# Altium schematic sheet PS_IO.SchDoc
size A4; SheetNumber: 2; SheetTotal: 11
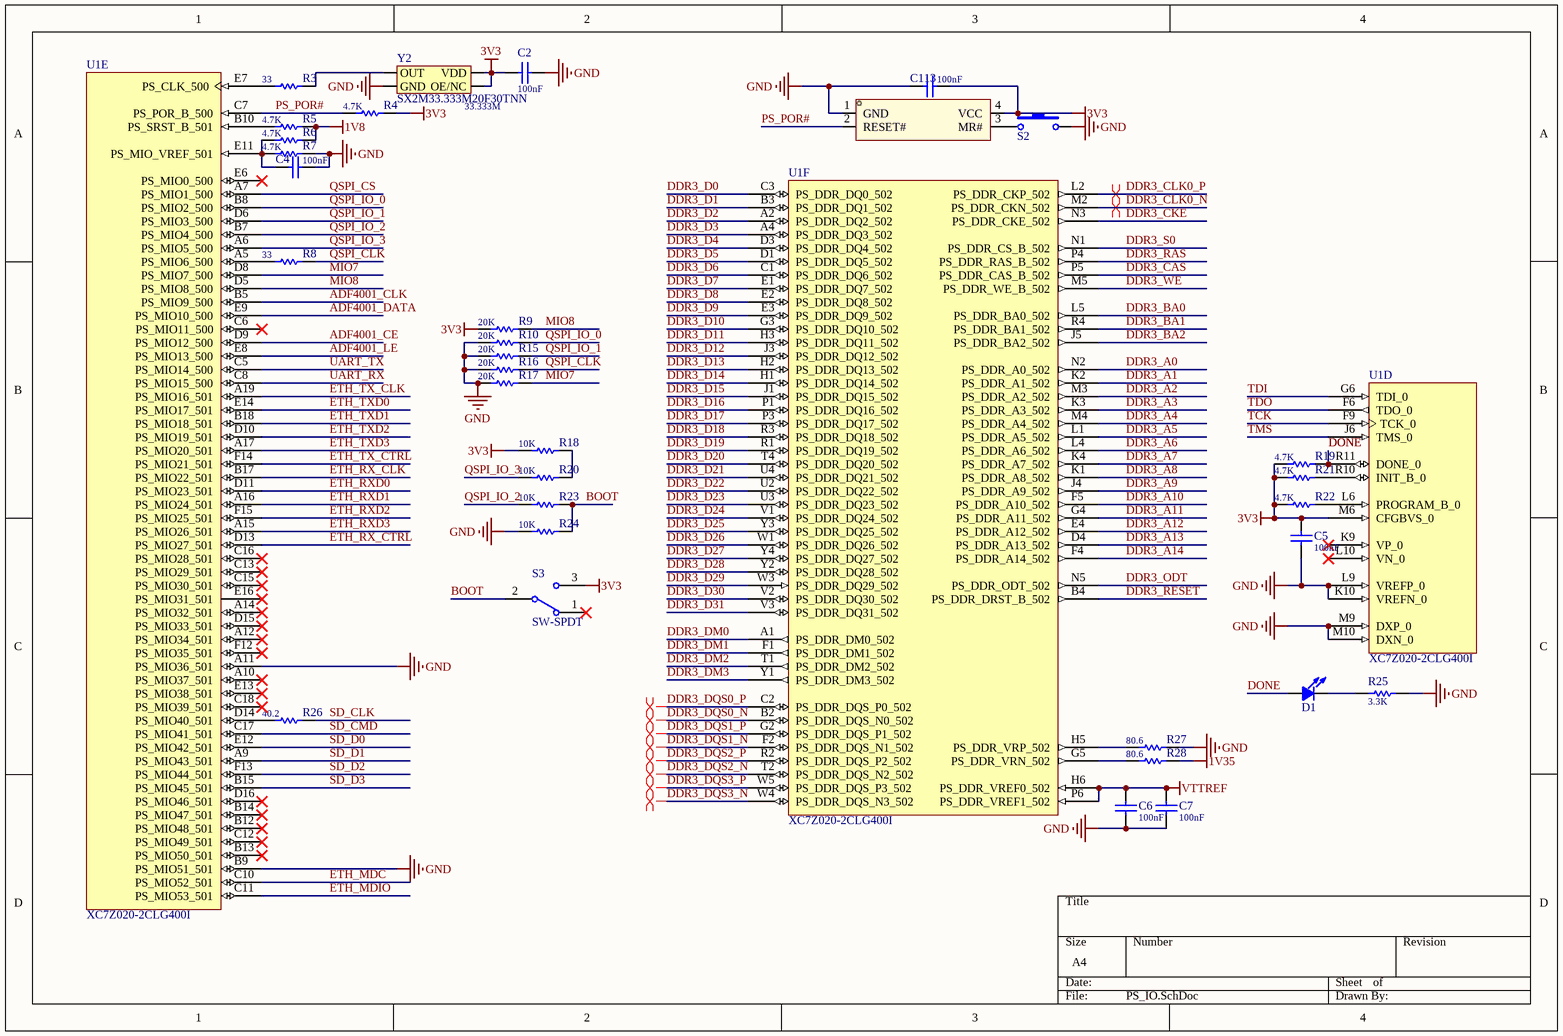
[diagram p0: PS_IO.SchDoc]

## Parts
C2  value 100nF  [C0402-L]  (hidden comment: Cap-S)
C4  value 100nF  [C0402-L]  (hidden comment: Cap-S)
C5  value 100nF  [C0402-L]  (hidden comment: Cap-S)
C6  value 100nF  [C0402-S]  (hidden comment: Cap-S)
C7  value 100nF  [C0402-S]  (hidden comment: Cap-S)
C113  value 100nF  [C0402-L]  (hidden comment: Cap-S)
D1  LED  [LED_0603_L]  (value not drawn)
R3  value 33  [R0402-L]  (hidden comment: R)
R4  value 4.7K  [R0402-L]  (hidden comment: R)
R5  value 4.7K  [R0402-L]  (hidden comment: R)
R6  value 4.7K  [R0402-L]  (hidden comment: R)
R7  value 4.7K  [R0402-L]  (hidden comment: R)
R8  value 33  [R0402-L]  (hidden comment: R)
R9  value 20K  [R0402-L]  (hidden comment: R)
R10  value 20K  [R0402-L]  (hidden comment: R)
R15  value 20K  [R0402-L]  (hidden comment: R)
R16  value 20K  [R0402-L]  (hidden comment: R)
R17  value 20K  [R0402-L]  (hidden comment: R)
R18  value 10K  [R0402-L]  (hidden comment: R)
R19  value 4.7K  [R0402-L]  (hidden comment: R)
R20  value 10K  [R0402-L]  (hidden comment: R)
R21  value 4.7K  [R0402-L]  (hidden comment: R)
R22  value 4.7K  [R0402-L]  (hidden comment: R)
R23  value 10K  [R0402-L]  (hidden comment: R)
R24  value 10K  [R0402-L]  (hidden comment: R)
R25  value 3.3K  [R0603-L]  (hidden comment: R)
R26  value 40.2  [R0402-L]  (hidden comment: R)
R27  value 80.6  [R0402-S]  (hidden comment: R)
R28  value 80.6  [R0402-S]  (hidden comment: R)
S2  SW-PB2  [SW-PB2-SMD]  (value not drawn)
S3  SW-SPDT  [SW-TH_MSK12C02]
U1  XC7Z020-2CLG400I  [CLG400]  (parts D,E,F of 9)
U9  HX811T  [SOT-143_L2.9-W1.3-P1.92-LS2.3-BL]  (value not drawn)
Y2  SX2M33.333M20F30TNN  value 33.333M  [XTAL-2520]

## Nets
1V8: R5.1 R6.1
1V35: R28.1
3V3: C2.2 C5.1 C113.1 R4.1 R9.2 R18.2 R19.2 R21.2 R22.2 S3.3 U1.M6(CFGBVS_0) U9.4(VCC) Y2.1(OE/NC) Y2.4(VDD)
GND: C2.1 C4.1 C5.2 C6.1 C7.1 C113.2 R7.1 R10.2 R15.2 R16.2 R17.2 R24.2 R25.2 R27.1 S2.2 U1.A11(PS_MIO36_501) U1.B9(PS_MIO51_501) U1.K10(VREFN_0) U1.L9(VREFP_0) U1.M9(DXP_0) U1.M10(DXN_0) U9.1(GND) Y2.2(GND)
VTTREF: C6.2 C7.2 U1.H6(PS_DDR_VREF0_502) U1.P6(PS_DDR_VREF1_502)
ADF4001_CE: U1.D9(PS_MIO12_500)
ADF4001_CLK: U1.B5(PS_MIO9_500)
ADF4001_DATA: U1.E9(PS_MIO10_500)
ADF4001_LE: U1.E8(PS_MIO13_500)
BOOT: R23.1 R24.1 S3.2
DDR3_A0: U1.N2(PS_DDR_A0_502)
DDR3_A1: U1.K2(PS_DDR_A1_502)
DDR3_A2: U1.M3(PS_DDR_A2_502)
DDR3_A3: U1.K3(PS_DDR_A3_502)
DDR3_A4: U1.M4(PS_DDR_A4_502)
DDR3_A5: U1.L1(PS_DDR_A5_502)
DDR3_A6: U1.L4(PS_DDR_A6_502)
DDR3_A7: U1.K4(PS_DDR_A7_502)
DDR3_A8: U1.K1(PS_DDR_A8_502)
DDR3_A9: U1.J4(PS_DDR_A9_502)
DDR3_A10: U1.F5(PS_DDR_A10_502)
DDR3_A11: U1.G4(PS_DDR_A11_502)
DDR3_A12: U1.E4(PS_DDR_A12_502)
DDR3_A13: U1.D4(PS_DDR_A13_502)
DDR3_A14: U1.F4(PS_DDR_A14_502)
DDR3_BA0: U1.L5(PS_DDR_BA0_502)
DDR3_BA1: U1.R4(PS_DDR_BA1_502)
DDR3_BA2: U1.J5(PS_DDR_BA2_502)
DDR3_CAS: U1.P5(PS_DDR_CAS_B_502)
DDR3_CKE: U1.N3(PS_DDR_CKE_502)
DDR3_CLK0_N: U1.M2(PS_DDR_CKN_502)
DDR3_CLK0_P: U1.L2(PS_DDR_CKP_502)
DDR3_D0: U1.C3(PS_DDR_DQ0_502)
DDR3_D1: U1.B3(PS_DDR_DQ1_502)
DDR3_D2: U1.A2(PS_DDR_DQ2_502)
DDR3_D3: U1.A4(PS_DDR_DQ3_502)
DDR3_D4: U1.D3(PS_DDR_DQ4_502)
DDR3_D5: U1.D1(PS_DDR_DQ5_502)
DDR3_D6: U1.C1(PS_DDR_DQ6_502)
DDR3_D7: U1.E1(PS_DDR_DQ7_502)
DDR3_D8: U1.E2(PS_DDR_DQ8_502)
DDR3_D9: U1.E3(PS_DDR_DQ9_502)
DDR3_D10: U1.G3(PS_DDR_DQ10_502)
DDR3_D11: U1.H3(PS_DDR_DQ11_502)
DDR3_D12: U1.J3(PS_DDR_DQ12_502)
DDR3_D13: U1.H2(PS_DDR_DQ13_502)
DDR3_D14: U1.H1(PS_DDR_DQ14_502)
DDR3_D15: U1.J1(PS_DDR_DQ15_502)
DDR3_D16: U1.P1(PS_DDR_DQ16_502)
DDR3_D17: U1.P3(PS_DDR_DQ17_502)
DDR3_D18: U1.R3(PS_DDR_DQ18_502)
DDR3_D19: U1.R1(PS_DDR_DQ19_502)
DDR3_D20: U1.T4(PS_DDR_DQ20_502)
DDR3_D21: U1.U4(PS_DDR_DQ21_502)
DDR3_D22: U1.U2(PS_DDR_DQ22_502)
DDR3_D23: U1.U3(PS_DDR_DQ23_502)
DDR3_D24: U1.V1(PS_DDR_DQ24_502)
DDR3_D25: U1.Y3(PS_DDR_DQ25_502)
DDR3_D26: U1.W1(PS_DDR_DQ26_502)
DDR3_D27: U1.Y4(PS_DDR_DQ27_502)
DDR3_D28: U1.Y2(PS_DDR_DQ28_502)
DDR3_D29: U1.W3(PS_DDR_DQ29_502)
DDR3_D30: U1.V2(PS_DDR_DQ30_502)
DDR3_D31: U1.V3(PS_DDR_DQ31_502)
DDR3_DM0: U1.A1(PS_DDR_DM0_502)
DDR3_DM1: U1.F1(PS_DDR_DM1_502)
DDR3_DM2: U1.T1(PS_DDR_DM2_502)
DDR3_DM3: U1.Y1(PS_DDR_DM3_502)
DDR3_DQS0_N: U1.B2(PS_DDR_DQS_N0_502)
DDR3_DQS0_P: U1.C2(PS_DDR_DQS_P0_502)
DDR3_DQS1_N: U1.F2(PS_DDR_DQS_N1_502)
DDR3_DQS1_P: U1.G2(PS_DDR_DQS_P1_502)
DDR3_DQS2_N: U1.T2(PS_DDR_DQS_N2_502)
DDR3_DQS2_P: U1.R2(PS_DDR_DQS_P2_502)
DDR3_DQS3_N: U1.W4(PS_DDR_DQS_N3_502)
DDR3_DQS3_P: U1.W5(PS_DDR_DQS_P3_502)
DDR3_ODT: U1.N5(PS_DDR_ODT_502)
DDR3_RAS: U1.P4(PS_DDR_RAS_B_502)
DDR3_RESET: U1.B4(PS_DDR_DRST_B_502)
DDR3_S0: U1.N1(PS_DDR_CS_B_502)
DDR3_WE: U1.M5(PS_DDR_WE_B_502)
DONE: D1.1 R19.1 U1.R11(DONE_0)
ETH_MDC: U1.C10(PS_MIO52_501)
ETH_MDIO: U1.C11(PS_MIO53_501)
ETH_RX_CLK: U1.B17(PS_MIO22_501)
ETH_RX_CTRL: U1.D13(PS_MIO27_501)
ETH_RXD0: U1.D11(PS_MIO23_501)
ETH_RXD1: U1.A16(PS_MIO24_501)
ETH_RXD2: U1.F15(PS_MIO25_501)
ETH_RXD3: U1.A15(PS_MIO26_501)
ETH_TX_CLK: U1.A19(PS_MIO16_501)
ETH_TX_CTRL: U1.F14(PS_MIO21_501)
ETH_TXD0: U1.E14(PS_MIO17_501)
ETH_TXD1: U1.B18(PS_MIO18_501)
ETH_TXD2: U1.D10(PS_MIO19_501)
ETH_TXD3: U1.A17(PS_MIO20_501)
MIO7: R17.1 U1.D8(PS_MIO7_500)
MIO8: R9.1 U1.D5(PS_MIO8_500)
PS_POR#: R4.2 U1.C7(PS_POR_B_500) U9.2(RESET#)
QSPI_CLK: R8.1 R16.1
QSPI_CS: U1.A7(PS_MIO1_500)
QSPI_IO_0: R10.1 U1.B8(PS_MIO2_500)
QSPI_IO_1: R15.1 U1.D6(PS_MIO3_500)
QSPI_IO_2: R23.2 U1.B7(PS_MIO4_500)
QSPI_IO_3: R20.2 U1.A6(PS_MIO5_500)
SD_CLK: R26.1
SD_CMD: U1.C17(PS_MIO41_501)
SD_D0: U1.E12(PS_MIO42_501)
SD_D1: U1.A9(PS_MIO43_501)
SD_D2: U1.F13(PS_MIO44_501)
SD_D3: U1.B15(PS_MIO45_501)
TCK: U1.F9(TCK_0)
TDI: U1.G6(TDI_0)
TDO: U1.F6(TDO_0)
TMS: U1.J6(TMS_0)
UART_RX: U1.C8(PS_MIO15_500)
UART_TX: U1.C5(PS_MIO14_500)
NetC4_2: C4.2 R6.2 R7.2 U1.E11(PS_MIO_VREF_501)
NetD1_2: D1.2 R25.1
NetR3_1: R3.1 Y2.3(OUT)
NetR3_2: R3.2 U1.E7(PS_CLK_500)
NetR5_2: R5.2 U1.B10(PS_SRST_B_501)
NetR8_2: R8.2 U1.A5(PS_MIO6_500)
NetR18_1: R18.1 R20.1
NetR21_1: R21.1 U1.R10(INIT_B_0)
NetR22_1: R22.1 U1.L6(PROGRAM_B_0)
NetR26_2: R26.2 U1.D14(PS_MIO40_501)
NetR27_2: R27.2 U1.H5(PS_DDR_VRP_502)
NetR28_2: R28.2 U1.G5(PS_DDR_VRN_502)
NetS2_1: S2.1 U9.3(MR#)

Not connected (* = marked no-connect by the designer): S3 1*; U1 A10(PS_MIO37_501)* A12(PS_MIO34_501)* A14(PS_MIO32_501)* B12(PS_MIO48_501)* B13(PS_MIO50_501)* B14(PS_MIO47_501)* C6(PS_MIO11_500)* C12(PS_MIO49_501)* C13(PS_MIO29_501)* C15(PS_MIO30_501)* C16(PS_MIO28_501)* C18(PS_MIO39_501)* D15(PS_MIO33_501)* D16(PS_MIO46_501)* E6(PS_MIO0_500)* E13(PS_MIO38_501)* E16(PS_MIO31_501)* F12(PS_MIO35_501)* K9(VP_0)* L10(VN_0)*

## Layout directives
differential pair: DDR3_CLK0_N, DDR3_CLK0_P, DDR3_DQS0_N, DDR3_DQS0_P, DDR3_DQS1_N, DDR3_DQS1_P, DDR3_DQS2_N, DDR3_DQS2_P, DDR3_DQS3_N, DDR3_DQS3_P

## Library data of the parts
C2 C4-C7 C113 = Cap-S: 贴片瓷片电容
D1 = LED: 发光二极管
R3-R10 R15-R28 = Res: 贴片电阻
S2 = SW-PB2: 贴片式2脚微动开关
S3 = SW-SPDT: SPDT Subminiature Toggle Switch, Right Angle Mounting, Vertical Actuation; ComponentLink1Description: Manufacturer Link; ComponentLink1URL: http://www.apem.com
U1 = CMP-0363-00003-3: 733 MHz Zynq™-7000 AP SoC, 130 PS I/O, 125 FPGA I/O, 400-Ball BGA, Speed Grade 2, Industrial Grade, Pb-Free; LUTs: 53200; Flip Flops: 106400; Speed Grade: -2; Extensible Block RAM (# 36Kb Blocks): 560 KB (140); ComponentLink2URL: http://www.xilinx.com/support/documentation/user_guides/ug865-Zynq-7000-Pkg-Pinout.pdf; ComponentLink1Description: Datasheet; PartNumber: XC7Z020-2CLG400I; ComponentLink3URL: http://www.xilinx.com/support/documentation/data_sheets/ds187-XC7Z010-XC7Z020-Data-Sheet.pdf; Mounting Technology: Surface Mount; ComponentLink6Description: PCB and Layout Guide; ComponentLink3Description: DC and AC Switching Characteristics; ComponentLink4Description: Package File; PackageVersion: Rev 1.1, 09/2012; ComponentLink6URL: http://www.xilinx.com/support/documentation/user_guides/ug483_7Series_PCB.pdf; PackageDescription: Wire-Bond Chip-Scale BGA, Body 17 x 17 mm, 0.8 mm Pitch; ComponentLink5Description: Packaging and Pinout; Generic Part Number: XC7Z020; RoHS: Pb-Free; PackageReference: CLG400; ComponentLink1URL: http://www.xilinx.com/support/documentation/data_sheets/ds190-Zynq-7000-Overview.pdf; ComponentLink2Description: Package Specification; ComponentLink5URL: http://www.xilinx.com/support/documentation/user_guides/ug865-Zynq-7000-Pkg-Pinout.pdf; DatasheetVersion: v1.2; ComponentLink4URL: http://www.xilinx.com/support/packagefiles/z7packages/xc7z020clg400pkg.txt; Code_JEDEC: MO-275-MMAA-1
U9 = HX811T: Manufacturer: HX(恒佳兴); Add into BOM: yes; Symbol: HX811T; Device: HX811T; LCSC Part Name: 检测复位IC  HX811T; Supplier Part: C296128; Manufacturer Part: HX811T; Supplier Footprint: SOT-143; JLCPCB Part Class: Extended Part; Datasheet: https://atta.szlcsc.com/upload/public/pdf/source/20181119/C296130_13C074D56463349345A6B8D040F0FFA0.pdf; Supplier: LCSC; Convert to PCB: yes
Y2 = XTALS: 贴片有源晶振